# Altium schematic sheet 300_DC-DC_Part2.SchDoc: *DC-DC Convertion stage
size A4; Date: xxxxxx; DrawnBy: J.A.Oviedo; Revision: *R1V1; SheetNumber: 4; SheetTotal: 5
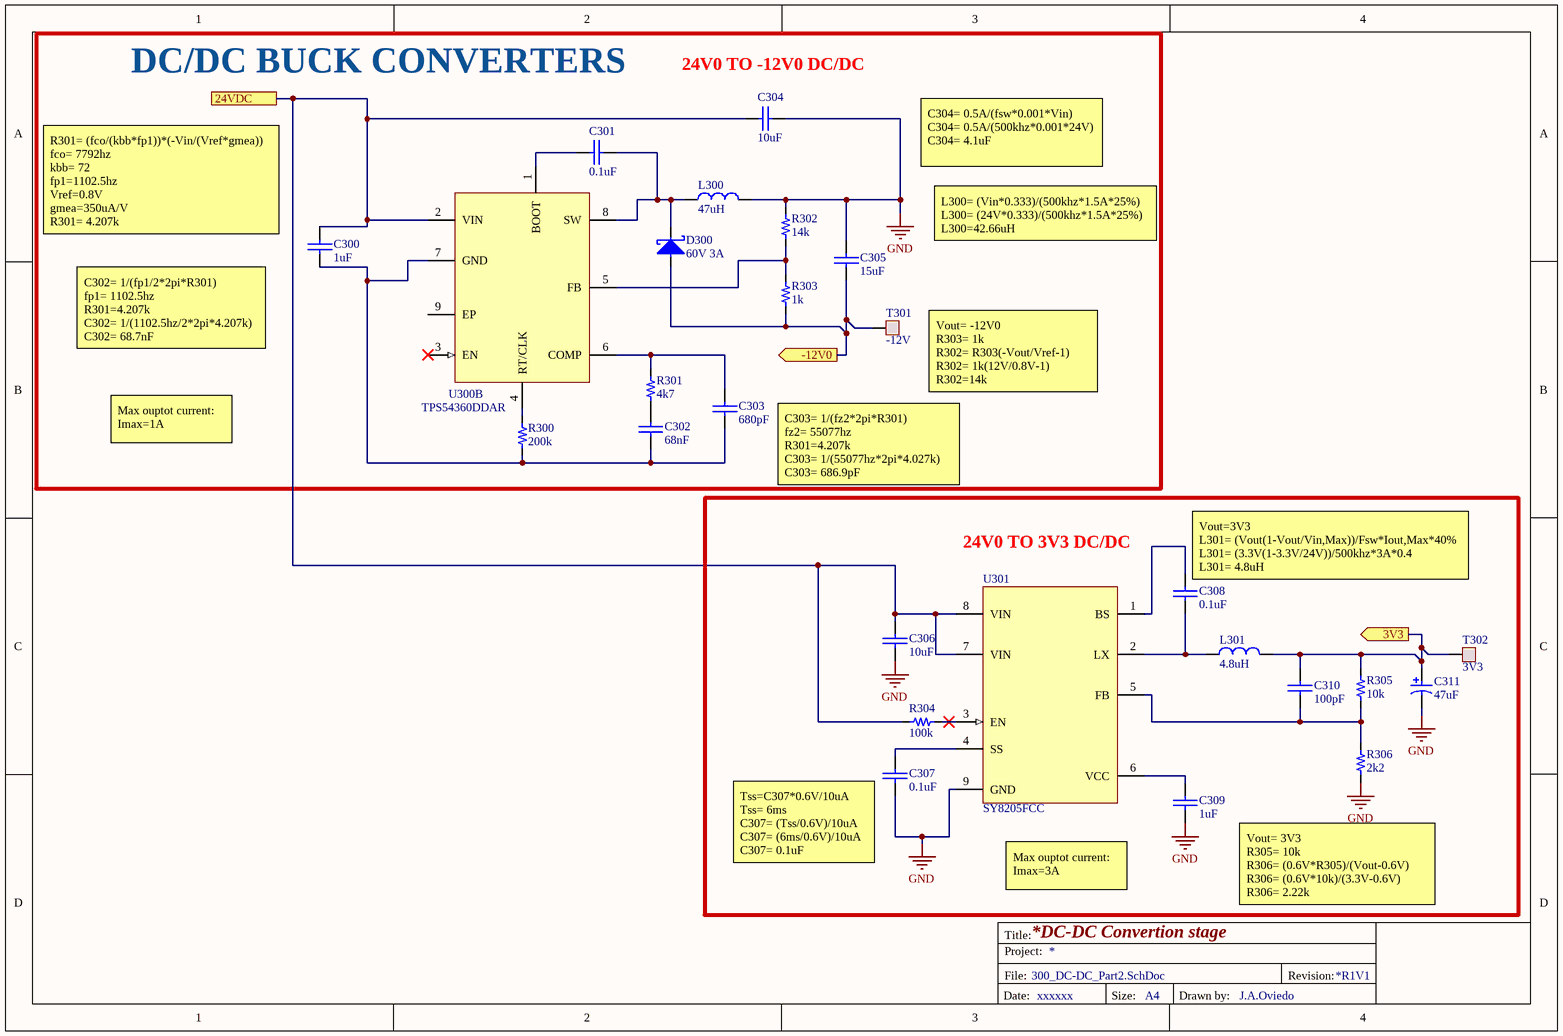
[diagram p0: 300_DC-DC_Part2.SchDoc]

## Parts
C300  value 1uF  [Cap_1uF_0603_X5R_50V]  (hidden comment: 1uF_50V)
C301  value 0.1uF  [0402_RF]  (hidden comment: 100nF 25V)
C302  value 68nF  [0603_1.4mm]  (hidden comment: 0.068uF 50V)
C303  value 680pF  [0603]  (hidden comment: 680pF 50V)
C304  value 10uF  [1206]  (hidden comment: 10uF 50V)
C305  value 15uF  [Cap_15uF_X5R-0805_25V]  (hidden comment: 15uF_25V)
C306  value 10uF  [1206]  (hidden comment: 10uF 50V)
C307  value 0.1uF  [0603]  (hidden comment: 0.1uF 50V)
C308  value 0.1uF  [0603]  (hidden comment: 0.1uF 50V)
C309  value 1uF  [0805]  (hidden comment: 1uF 25V)
C310  value 100pF  [0201]  (hidden comment: 100pF 25V)
C311  value 47uF  [RADIAL-CAN_LSx2.54mm_Diax6.35mm]  (hidden comment: 47uF 25V)
D300  60V 3A  [DO_214AC]
L300  value 47uH  [L-SMD_47uH_2.6A_12.5*12.5]  (hidden comment: 47uH_2.6A)
L301  value 4.8uH  [L_4.8uH_11A_1312]  (hidden comment: 4.8uH_11A)
R300  value 200k  [0603]  (hidden comment: 200k 1/10W)
R301  value 4k7  [0603]  (hidden comment: 4k7 1/10W)
R302  value 14k  [Res_14k_0603-SMD_0.125W]  (hidden comment: 14K_0.125W)
R303  value 1k  [0603]  (hidden comment: 1k 1/10W)
R304  value 100k  [0603]  (hidden comment: 100k 1/10W)
R305  value 10k  [0603]  (hidden comment: 10k 1/10W)
R306  value 2k2  [0603]  (hidden comment: 2k2 1/10W)
T301  -12V  [TP_SMD_45mil]  (no BOM)
T302  3V3  [TP_SMD_45mil]  (no BOM)
U300  TPS54360DDAR  [SOIC127P600X170_HS-9N]  (part B of 2)
U301  SY8205FCC  [SOIC127P600X160_HS-9N]

## Blocks framed on the sheet
DC/DC BUCK CONVERTERS: C300-C305 D300 L300 R300-R303 T301 U300
24V0 TO 3V3 DC/DC: C306-C311 L301 R304-R306 T302 U301

## Ports
3V3 (out, see 000_Hierarchical[4C]), 24VDC (see 000_Hierarchical[3C], 100_AC-DC[4B], 200_DC-DC[1A], 400_DC-DC_Part3[1B]), -12V0 (out, see 000_Hierarchical[4B])

## Nets
GND: C304.2 C305.1 C306.2 C307.2 C309.2 C311.2 L300.2 R302.2 R306.1 U301.9(GND)
3V3: C310.1 C311.1 L301.2 R305.2 T302.1 ; port 3V3
24VDC: C300.1 C304.1 C306.1 R304.1 U300.2(VIN) U301.7(VIN) U301.8(VIN) ; port 24VDC
-12V0: C305.2 D300.2 R303.1 T301.1 ; port -12V0
NetC300_2: C300.2 C302.2 C303.2 R300.1 U300.7(GND)
NetC301_1: C301.1 D300.1 L300.1 U300.8(SW)
NetC301_2: C301.2 U300.1(BOOT)
NetC302_1: C302.1 R301.1
NetC303_1: C303.1 R301.2 U300.6(COMP)
NetC307_1: C307.1 U301.4(SS)
NetC308_1: C308.1 U301.1(BS)
NetC308_2: C308.2 L301.1 U301.2(LX)
NetC309_1: C309.1 U301.6(VCC)
NetC310_2: C310.2 R305.1 R306.2 U301.5(FB)
NetR300_2: R300.2 U300.4(RT/CLK)
NetR302_1: R302.1 R303.2 U300.5(FB)
NetR304_2: R304.2 U301.3(EN)

Not connected (* = marked no-connect by the designer): U300 3(EN)* 9(EP)

## Notes on the sheet
- (near C304) 24V0 TO -12V0 DC/DC
- C304= 0.5A/(fsw*0.001*Vin)
  C304= 0.5A/(500khz*0.001*24V)
  C304= 4.1uF
- (near C300) R301= (fco/(kbb*fp1))*(-Vin/(Vref*gmea))
  fco= 7792hz
  kbb= 72
  fp1=1102.5hz
  Vref=0.8V
  gmea=350uA/V
  R301= 4.207k
- L300= (Vin*0.333)/(500khz*1.5A*25%)
  L300= (24V*0.333)/(500khz*1.5A*25%)
  L300=42.66uH
- C302= 1/(fp1/2*2pi*R301)
  fp1= 1102.5hz
  R301=4.207k
  C302= 1/(1102.5hz/2*2pi*4.207k)
  C302= 68.7nF
- Max ouptot current: Imax=1A
- (near T301) Vout= -12V0                                       R303= 1k                                            R302= R303(-Vout/Vref-1)
  R302= 1k(12V/0.8V-1)
  R302=14k
- C303= 1/(fz2*2pi*R301)
  fz2= 55077hz
  R301=4.207k
  C303= 1/(55077hz*2pi*4.027k)
  C303= 686.9pF
- (near C308) Vout=3V3                                                                                   L301= (Vout(1-Vout/Vin,Max))/Fsw*Iout,Max*40%
  L301= (3.3V(1-3.3V/24V))/500khz*3A*0.4                L301= 4.8uH
- (near C307) Tss=C307*0.6V/10uA
  Tss= 6ms                     C307= (Tss/0.6V)/10uA        C307= (6ms/0.6V)/10uA       C307= 0.1uF
- Max ouptot current: Imax=3A
- Vout= 3V3                                       R305= 10k                                            R306= (0.6V*R305)/(Vout-0.6V)
  R306= (0.6V*10k)/(3.3V-0.6V)             R306= 2.22k
- Title:
- Project:
- File:
- Revision:
- Date:
- Size:
- A4
- Drawn by:

## Library data of the parts
C300 = Cap_1uF_0603_X5R_50V: C0603X5R500-105KNP-CT; Manufacturer: Venkel; Manufacturer Part Number: C0603X5R500-105KNP-CT; Supplier 1: Digi-Key; Supplier Part Number 1: 2679-C0603X5R500-105KNP-CT-ND; Last modified by: J.A.Oviedo; Last modified date: 20261021
C301 = Cap_0.1uF_0402_25V: CAP CER 0.1UF 25V X7R 0402; Manufacturer: Yageo; Manufacturer Part Number: CC0402KRX7R8BB104; Last modified by: J.Jaramillo; Last modified date: 20240309; ComponentLink1Description: Digi-key; ComponentLink1URL: https://www.digikey.com/products/en?keywords=311-2077-1-ND; Supplier 1: Digi-Key; Supplier Part Number 1: 311-2077-1-ND
C302 = Cap_0.068uF_0603_50V: CAP CER 0.068UF 50V X7R 0603; Manufacturer: Samsung Electro-Mechanics; Manufacturer Part Number: CL10B683KB8NNNC; Reel stock: N/A; Last modified by: J.Jaramillo; Last modified date: 20240309; ComponentLink1Description: Digi-key; ComponentLink1URL: https://www.digikey.com/product-detail/en/samsung-electro-mechanics/CL10B683KB8NNNC/1276-1814-1-ND/3889900; Supplier 1: Digi-Key; Supplier Part Number 1: 1276-1814-1-ND
C303 = Cap_680pF_0603_50V: CAP CER 680PF 50V X7R 0603; Manufacturer: KEMET; Manufacturer Part Number: C0603C681K5RAC7867; Supplier 1: Digi-Key; Supplier Part Number 1: 399-C0603C681K5RAC7867CT-ND; Last modified by: J.Jaramillo; Last modified date: 20240309; ComponentLink1Description: Digi-Key; ComponentLink1URL: https://www.digikey.com/en/products/detail/kemet/C0603C681K5RAC7867/411079
C304 C306 = Cap_10uF_1206_50V: CAP CER 10UF 50V X5R 1206; Manufacturer: Murata Electronics North America; Manufacturer Part Number: GRT31CR61H106ME01L; Last modified by: J.Jaramillo; Last modified date: 20240309; ComponentLink1Description: Digi-Key; ComponentLink1URL: https://www.digikey.com/product-detail/en/murata-electronics-north-america/GRT31CR61H106ME01L/490-12457-1-ND/5417158; Supplier 1: Digi-Key; Supplier Part Number 1: 490-12457-1-ND
C305 = Cap_15uF_X5R-0805_25V: CAP CER 15UF 25V X5R 0805; Manufacturer: TDK; Manufacturer Part Number: C2012X5R1E156M125AC; Supplier 1: Digi-Key; Supplier Part Number 1: 445-9078-1-ND; Last modified by: J.A.Oviedo; Last modified date: 20261021
C307 C308 = Cap_0.1uF_0603_50V: CAP CER 0.1UF 50V X7R 0603; Manufacturer: Samsung Electro-Mechanics; Manufacturer Part Number: CL10B104JB8NNNC; Supplier 1: Digi-Key; Supplier Part Number 1: 1276-1033-1-ND; Last modified by: J.Jaramillo; Last modified date: 20240309; ComponentLink1Description: Digi-key; ComponentLink1URL: https://www.digikey.com/en/products/detail/samsung-electro-mechanics/CL10B104JB8NNNC/3886691?s=N4IgTCBcDaIIxgOwDYC0cAMBmL7UDkAREAXQF8g
C309 = Cap_1uF_0805_25V: CAP CER 1UF 25V X7R 0805; Manufacturer: Yageo; Manufacturer Part Number: CC0805KKX7R8BB105; Supplier 1: Digi-Key; Supplier Part Number 1: 311-1456-1-ND; Last modified by: J.Jaramillo; Last modified date: 20240309; ComponentLink1Description: Digi-Key; ComponentLink1URL: https://www.digikey.com/product-detail/en/yageo/CC0805KKX7R8BB105/311-1456-1-ND/2833762
C310 = Cap_100pF_0201_25V: CAP CER 100PF 25V NP0 0201; Manufacturer: Murata Electronics; Manufacturer Part Number: GRM0335C1E101GA01D; Supplier 1: Digi-Key; Supplier Part Number 1: 490-17802-1-ND; Last modified by: J.Jaramillo; Last modified date: 20240309; ComponentLink1Description: Digi-Key; ComponentLink1URL: https://www.digikey.com/en/products/detail/murata-electronics/GRM0335C1E101GA01D/4358566?s=N4IgTCBcDaIOICUCyAGAzGgrAYQIwFFcVc4BBYgERAF0BfIA
C311 = Cap_47uF_25V_ALU_THT: CAP 47uf/25V,10*16,105℃ RADIAL; Manufacturer: SamXon; Manufacturer Part Number: KM 47U/25V; Last modified by: J.Jaramillo; Last modified date: 20240309; Supplier 1: Poshton; Supplier Part Number 1: KM 47U/25V; ComponentLink1Description: Datasheet; ComponentLink1URL: CMP000351_KM-Series
D300 = D_Schottky_60V_3A_DO_214AC: DIODE SCHOTTKY 60V 3A DO214AC; Manufacturer: Taiwan Semiconductor Corporation; Manufacturer Part Number: TSSA3U60 R3G; Reel Stock: N/A; Last modified by: J.Jaramillo; Last modified date: 20240310; Supplier 1: Digi-Key; Supplier Part Number 1: TSSA3U60R3GCT-ND; ComponentLink1Description: Digi-Key; ComponentLink1URL: https://www.digikey.com/products/en?keywords=TSSA3U60R3GCT-ND
L300 = L-SMD_47uH_2.6A_12.5*12.5: FIXED IND 47UH 2.6A 86 MOHM SMD; Manufacturer: Bourns Inc.; Manufacturer Part Number: SRR1260-470M; Supplier 1: Digi-key; Supplier Part Number 1: SRR1260-470MCT-ND; Reel Stock: N/A; Last modified by: J.A.Oviedo; Last modified date: 20261021
L301 = L_4.8uH_11A_1312: 11A 4.8uH ±20% 11.55mΩ 13A Molded inductor SMD,13x12.8mm Fixed Inductors; Manufacturer: Coilank; Manufacturer Part Number: APZBX1250M4R8; Supplier 1: LCSC; Supplier Part Number 1: C54623473; Reel Stock: N/A; Last modified by: J.A.Oviedo; Last modified date: 20261020
R300 = Res_200k_0603_1/10W: RES 200K OHM 1% 1/10W 0603; Manufacturer: Stackpole Electronics Inc; Manufacturer Part Number: RMCF0603FT200K; Supplier 1: Digi-Key; Supplier Part Number 1: RMCF0603FT200KCT-ND; Reel Stock: N/A; Last modified by: J.Jaramillo; Last modified date: 20240310; ComponentLink1Description: Digi-Key; ComponentLink1URL: https://www.digikey.com/en/products/detail/stackpole-electronics-inc/RMCF0603FT200K/1760715
R301 = Res_4k7_0603_1/10W: RES SMD 4.7K OHM 1% 1/10W 0603; Manufacturer: Yageo; Manufacturer Part Number: RC0603FR-074K7L; Supplier 1: Digi-Key; Supplier Part Number 1: 311-4.70KHRCT-ND; Reel Stock: N/A; Last modified by: J.Jaramillo; Last modified date: 20240310; ComponentLink1Description: Digi-Key; ComponentLink1URL: https://www.digikey.com/product-detail/en/yageo/RC0603FR-074K7L/311-4-70KHRCT-ND/730159
R302 = Res_14k_0603-SMD_0.125W: RES 14kΩ ±1% 125mW 0805; Manufacturer: FOJAN; Manufacturer Part Number: FRC0805F1402TS; Supplier 1: LCSC; Supplier Part Number 1: FOJAN FRC0805F1402TS; Reel Stock: N/A; Last modified by: J.A.Oviedo; Last modified date: 20261021; ComponentLink1Description: LCSC; ComponentLink1URL: https://www.lcsc.com/es/product-detail/C2930168.html?s_z=n_q_t_resistor
R303 = Res_1k_0603_1/10W: RES SMD 1K OHM 1% 1/10W 0603; Manufacturer: Yageo; Manufacturer Part Number: RC0603FR-071KL; Supplier 1: Digi-Key; Supplier Part Number 1: 311-1.00KHRCT-ND; Reel Stock: N/A; Last modified by: J.Jaramillo; Last modified date: 20240310; ComponentLink1Description: Digi-Key; ComponentLink1URL: https://www.digikey.com/product-detail/en/yageo/RC0603FR-071KL/311-1-00KHRCT-ND/729790
R304 = Res_100k_0603_1/10W: RES 100k OHM 1% 1/10W 0603; Manufacturer: Stackpole Electronics Inc.; Manufacturer Part Number: RMCF0603FT100K; Supplier 1: Digi-Key; Supplier Part Number 1: RMCF0603FT100KCT-ND; Reel Stock: N/A; Last modified by: J.Jaramillo; Last modified date: 20240310; ComponentLink1Description: Digi-Key; ComponentLink1URL: https://www.digikey.com/product-detail/en/stackpole-electronics-inc/RMCF0603FT100K/RMCF0603FT100KCT-ND/1943118
R305 = Res_10k_0603_1/10W: RES SMD 10K OHM 1% 1/10W 0603; Manufacturer: Samsung Electro-Mechanics; Manufacturer Part Number: RC1608F103CS; ComponentLink1URL: https://www.digikey.com/products/en?keywords=1276-3485-1-ND; Supplier 1: Digi-Key; Supplier Part Number 1: 1276-3485-1-ND; Reel Stock: N/A; Last modified by: J.Jaramillo; Last modified date: 20240310; ComponentLink1Description: Digi-key
R306 = Res_2k2_0603_1/10W: RES SMD 2.2K OHM 1% 1/10W 0603; Manufacturer: Yageo; Manufacturer Part Number: RC0603FR-072K2L; Reel Stock: N/A; Last modified by: J.Jaramillo; Last modified date: 20240310; ComponentLink1Description: Digi-Key; ComponentLink1URL: https://www.digikey.com/en/products/detail/yageo/RC0603FR-072K2L/727016?s=N4IgTCBcDaIEoGEAMA2JBmAYnAtEg7GANJgAyIAugL5A; Supplier 1: Digi-Key; Supplier Part Number 1: 311-2.20KHRCT-ND
T301 T302 = TP_SMD_45mil: Test point 45mil pad size; Last modified by: J.Jaramillo; Last modified date: 20240310
U300 = DC/DC_ADJ_-12V_3.5A_SOIC-8-EP: 60V Input, 3.5A Output Step-Down DC-DC Converter; Manufacturer: TI; Manufacturer Part Number: TPS54360DDAR; Reel Stock: N/A; Last modified by: J.A.Oviedo; Last modified date: 2026/10/21; ComponentLink1Description: LCLS; ComponentLink1URL: https://www.lcsc.com/es/product-detail/C44377.html?s_z=n_q_TPS54360; ComponentLink2Description: DATASHEET; ComponentLink2URL: https://www.lcsc.com/datasheet/C44377.pdf; Supplier 1: Mouser; Supplier Part Number 1: 595-TPS54360DDAR
U301 = DC/DC_ADJ_5A_SOIC-8-EP: High Efficiency Fast Response, 5A, 30V Input Synchronous Step Down Regulator; Manufacturer: Silergy; Manufacturer Part Number: SY8205FCC; Supplier 1: LCSC; Supplier Part Number 1: C111875; Reel Stock: N/A; Last modified by: J.A.OVIEDO; Last modified date: 20261018; ComponentLink1Description: LCSC; ComponentLink1URL: https://www.lcsc.com/es/product-detail/C111875.html?s_z=n_q_SY8205FCC; ComponentLink2Description: DATASHEET; ComponentLink2URL: https://www.lcsc.com/datasheet/C111875.pdf